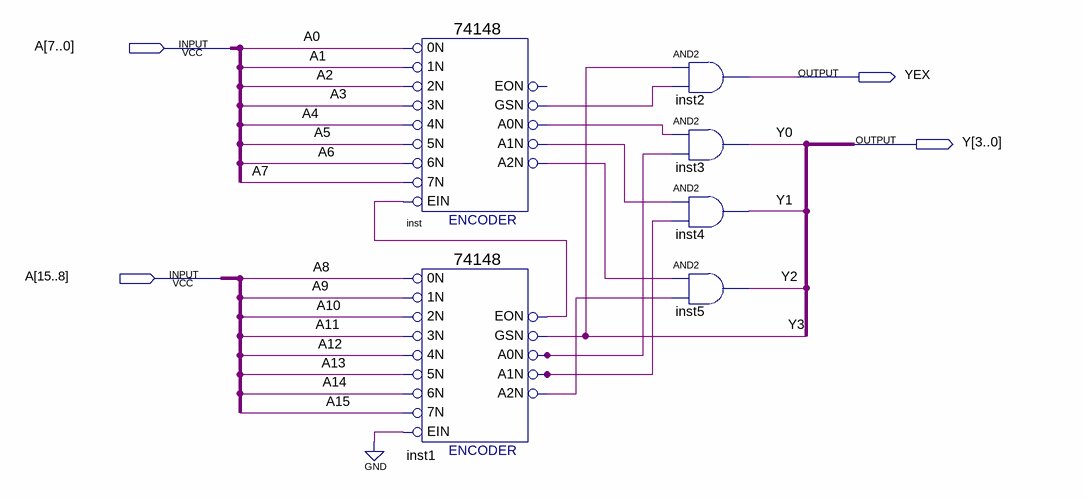
[diagram p0: schematic sheet]
// Quartus schematic 16-4.bdf as structural Verilog: 6 symbols, 4 pins
module \16-4  (
  input  [15:0] A,
  output YEX,
  output [3:0] Y
);

  wire inst1_a0n, inst1_a1n, inst1_a2n, inst1_eon, inst_a0n, inst_a1n, inst_a2n, inst_gsn;

  \74148  inst (
    .\5N (A[5]), .\0N (A[0]), .\1N (A[1]), .\2N (A[2]), .\3N (A[3]), .\4N (A[4]), .EIN(inst1_eon),
    .\6N (A[6]), .\7N (A[7]), .A1N(inst_a1n), .A0N(inst_a0n), .A2N(inst_a2n), .GSN(inst_gsn));  // open: EON
  \74148  inst1 (
    .\5N (A[13]), .\0N (A[8]), .\1N (A[9]), .\2N (A[10]), .\3N (A[11]), .\4N (A[12]), .EIN(1'b0),
    .\6N (A[14]), .\7N (A[15]), .A1N(inst1_a1n), .A0N(inst1_a0n), .A2N(inst1_a2n), .EON(inst1_eon), .GSN(Y[3]));
  and inst2 (YEX, Y[3], inst_gsn);
  and inst3 (Y[0], inst_a0n, inst1_a0n);
  and inst4 (Y[1], inst_a1n, inst1_a1n);
  and inst5 (Y[2], inst_a2n, inst1_a2n);
endmodule
